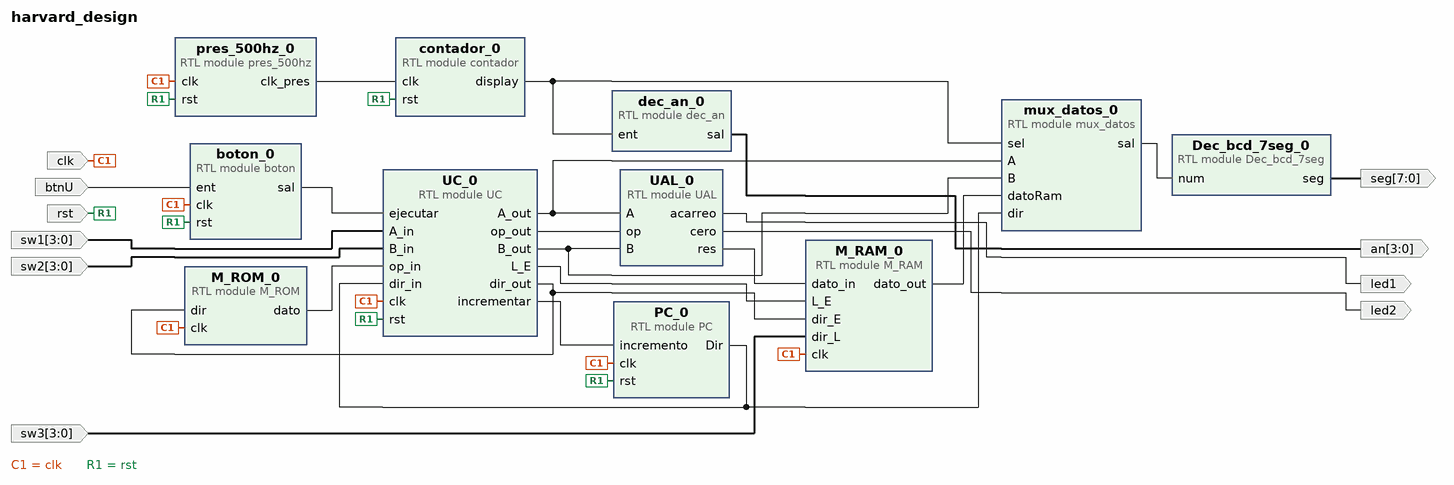
[diagram p0: block diagram of the top level]
# Vivado block design harvard_design, xc7a35tcpg236-1, Vivado 2026.1
create_bd_design harvard_design

create_bd_port -dir I -type clk clk
create_bd_port -dir I -type rst rst
create_bd_port -dir I btnU
create_bd_port -dir I -from 3 -to 0 sw1
create_bd_port -dir I -from 3 -to 0 sw2
create_bd_port -dir I -from 3 -to 0 sw3
create_bd_port -dir O -from 7 -to 0 seg
create_bd_port -dir O led1
create_bd_port -dir O led2
create_bd_port -dir O -from 3 -to 0 an

create_bd_cell -type module -reference pres_500hz pres_500hz_0
create_bd_cell -type module -reference mux_datos mux_datos_0
create_bd_cell -type module -reference dec_an dec_an_0
create_bd_cell -type module -reference contador contador_0
create_bd_cell -type module -reference boton boton_0
create_bd_cell -type module -reference UAL UAL_0
create_bd_cell -type module -reference PC PC_0
create_bd_cell -type module -reference M_ROM M_ROM_0
create_bd_cell -type module -reference M_RAM M_RAM_0
create_bd_cell -type module -reference Dec_bcd_7seg Dec_bcd_7seg_0
create_bd_cell -type module -reference UC UC_0

# ---- connections ----

connect_bd_net -net A_in_0_1 [get_bd_ports sw1] [get_bd_pins UC_0/A_in]
connect_bd_net -net B_in_0_1 [get_bd_ports sw2] [get_bd_pins UC_0/B_in]
connect_bd_net [get_bd_pins Dec_bcd_7seg_0/seg] [get_bd_ports seg]
connect_bd_net [get_bd_pins M_RAM_0/dato_out] [get_bd_pins mux_datos_0/datoRam]
connect_bd_net [get_bd_pins M_ROM_0/dato] [get_bd_pins UC_0/op_in]
connect_bd_net [get_bd_pins UC_0/dir_out] [get_bd_pins M_RAM_0/dir_E] [get_bd_pins M_ROM_0/dir]
connect_bd_net [get_bd_pins PC_0/Dir] [get_bd_pins UC_0/dir_in] [get_bd_pins mux_datos_0/dir]
connect_bd_net [get_bd_pins UAL_0/acarreo] [get_bd_ports led1]
connect_bd_net [get_bd_pins UAL_0/cero] [get_bd_ports led2]
connect_bd_net [get_bd_pins UAL_0/res] [get_bd_pins M_RAM_0/dato_in]
connect_bd_net [get_bd_pins UC_0/A_out] [get_bd_pins UAL_0/A] [get_bd_pins mux_datos_0/A]
connect_bd_net [get_bd_pins UC_0/B_out] [get_bd_pins UAL_0/B] [get_bd_pins mux_datos_0/B]
connect_bd_net [get_bd_pins UC_0/L_E] [get_bd_pins M_RAM_0/L_E]
connect_bd_net [get_bd_pins UC_0/incrementar] [get_bd_pins PC_0/incremento]
connect_bd_net [get_bd_pins UC_0/op_out] [get_bd_pins UAL_0/op]
connect_bd_net [get_bd_pins boton_0/sal] [get_bd_pins UC_0/ejecutar]
connect_bd_net -net clk_0_1 [get_bd_ports clk] \
  [get_bd_pins M_RAM_0/clk] [get_bd_pins M_ROM_0/clk] [get_bd_pins PC_0/clk] [get_bd_pins UC_0/clk] [get_bd_pins boton_0/clk] \
  [get_bd_pins pres_500hz_0/clk]
connect_bd_net [get_bd_pins contador_0/display] [get_bd_pins dec_an_0/ent] [get_bd_pins mux_datos_0/sel]
connect_bd_net [get_bd_pins dec_an_0/sal] [get_bd_ports an]
connect_bd_net -net dir_L_0_1 [get_bd_ports sw3] [get_bd_pins M_RAM_0/dir_L]
connect_bd_net -net ent_0_1 [get_bd_ports btnU] [get_bd_pins boton_0/ent]
connect_bd_net [get_bd_pins mux_datos_0/sal] [get_bd_pins Dec_bcd_7seg_0/num]
connect_bd_net [get_bd_pins pres_500hz_0/clk_pres] [get_bd_pins contador_0/clk]
connect_bd_net -net rst_0_1 [get_bd_ports rst] \
  [get_bd_pins PC_0/rst] [get_bd_pins UC_0/rst] [get_bd_pins boton_0/rst] [get_bd_pins contador_0/rst] \
  [get_bd_pins pres_500hz_0/rst]

validate_bd_design
save_bd_design
